# Altium schematic sheet Memory_FRAM.SchDoc: Memory - FRAM FM25V02A (SPI2)
size A3; ApprovedBy: Weymen Koo; CheckedBy: -; DrawnBy: Weymen Koo; DocumentNumber: UBCAD-FCSOM-SCH; Revision: A; SheetNumber: 10; SheetTotal: 18; ProjectTitle: Flight Controller SoM; Status: PRELIMINARY; ReleaseDate: 2026-11-14
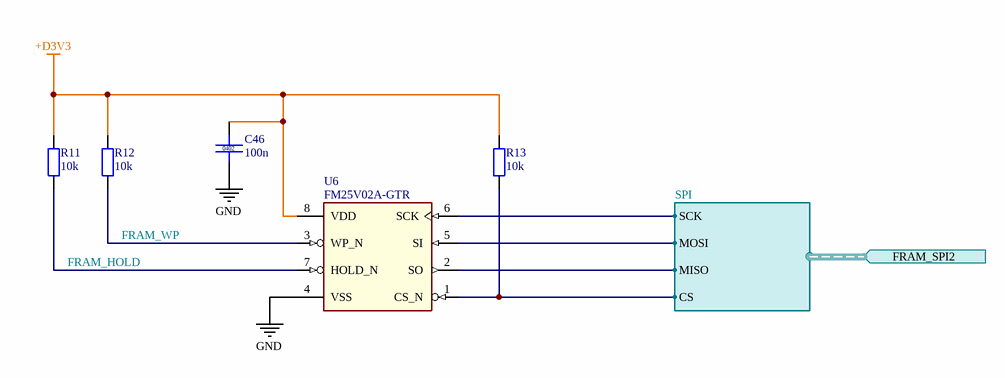
[diagram p0: Memory_FRAM.SchDoc]

## Parts
C46  100n  [CAPC1005X05N]
R11  10k  [IPC C R0402 NO SILK]
R12  10k  [IPC C R0402 NO SILK]
R13  10k  [IPC C R0402 NO SILK]
U6  FM25V02A-GTR  [SOIC127P602X173-8N-1-V]

## Ports
FRAM_SPI2 (in, harness SPI, see 1[4B], 4[2D])

## Harnesses
SPI: SCK, MOSI, MISO, CS

## Nets
+D3V3: C46.1 R11.2 R12.2 R13.2 U6.8(VDD)
GND: C46.2 U6.4(VSS)
FRAM_HOLD: R11.1 U6.7(HOLD_N)
FRAM_WP: R12.1 U6.3(WP_N)
NetR13_1: R13.1 U6.1(CS_N) ; port FRAM_SPI2.CS
NetU6_2: U6.2(SO) ; port FRAM_SPI2.MISO
NetU6_5: U6.5(SI) ; port FRAM_SPI2.MOSI
NetU6_6: U6.6(SCK) ; port FRAM_SPI2.SCK

## Notes on the sheet
- PROJECT
- KEY
- POWER
- 5 V class
- 3.3 V class
- Core / SMPS
- GND
- SHEET TITLE
- SIGNALS
- NOTES
- SPI
- Analog
- Design
- I2C
- PWM/Timer
- Layout
- UART/RC
- GPIO/Ctrl
- Assembly
- CAN
- Unused pin
- Firmware
- USB/SD/Clk
- Critical
- DRAWN
- DOCUMENT NO.
- CHECKED
- REV
- STATUS
- APPROVED
- DATE
- FILE
- SIZE
- A3
- SHEET
- of

## Library data of the parts
C46 = CMP-002-000094-5: CAP 100n 16V X7R 10% 0402; Manufacturer: Samsung; Manufacturer Part Number: CL05B104KO5NNNC; Value: 100n; Tolerance: 10%; Package: 0402; Voltage: 16V; Dielectric: X7R; LCSC Part #: C1525
R11-R13 = CMP-008-000000-2: RES 10k 1% 1/16W 0402; Manufacturer: UNI-ROYAL; Manufacturer Part Number: 0402WGF1002TCE; Value: 10k; Source: Schlib1.SchLib; Design Item ID: Generic RES 0402; Package: 0402; Tolerance: 1%; Power: 1/16W; LCSC Part #: C25744
U6 = CMP-029-000014-5: F-RAM, 256-Kbit (32K x 8), SPI, SOIC-8; Manufacturer: Infineon Technologies; Design Item ID: FM25V02A-GTR; PackageReference: PG-DSO-8-802; Source: FM25V02A-GTR.SchLib; Manufacturer Order Number: FM25V02A-GTR